# Altium schematic sheet POWER_DISTRIBUTION.SchDoc: Main_Power_Supp
size A3; Author: f; SheetNumber: 3; SheetTotal: 17
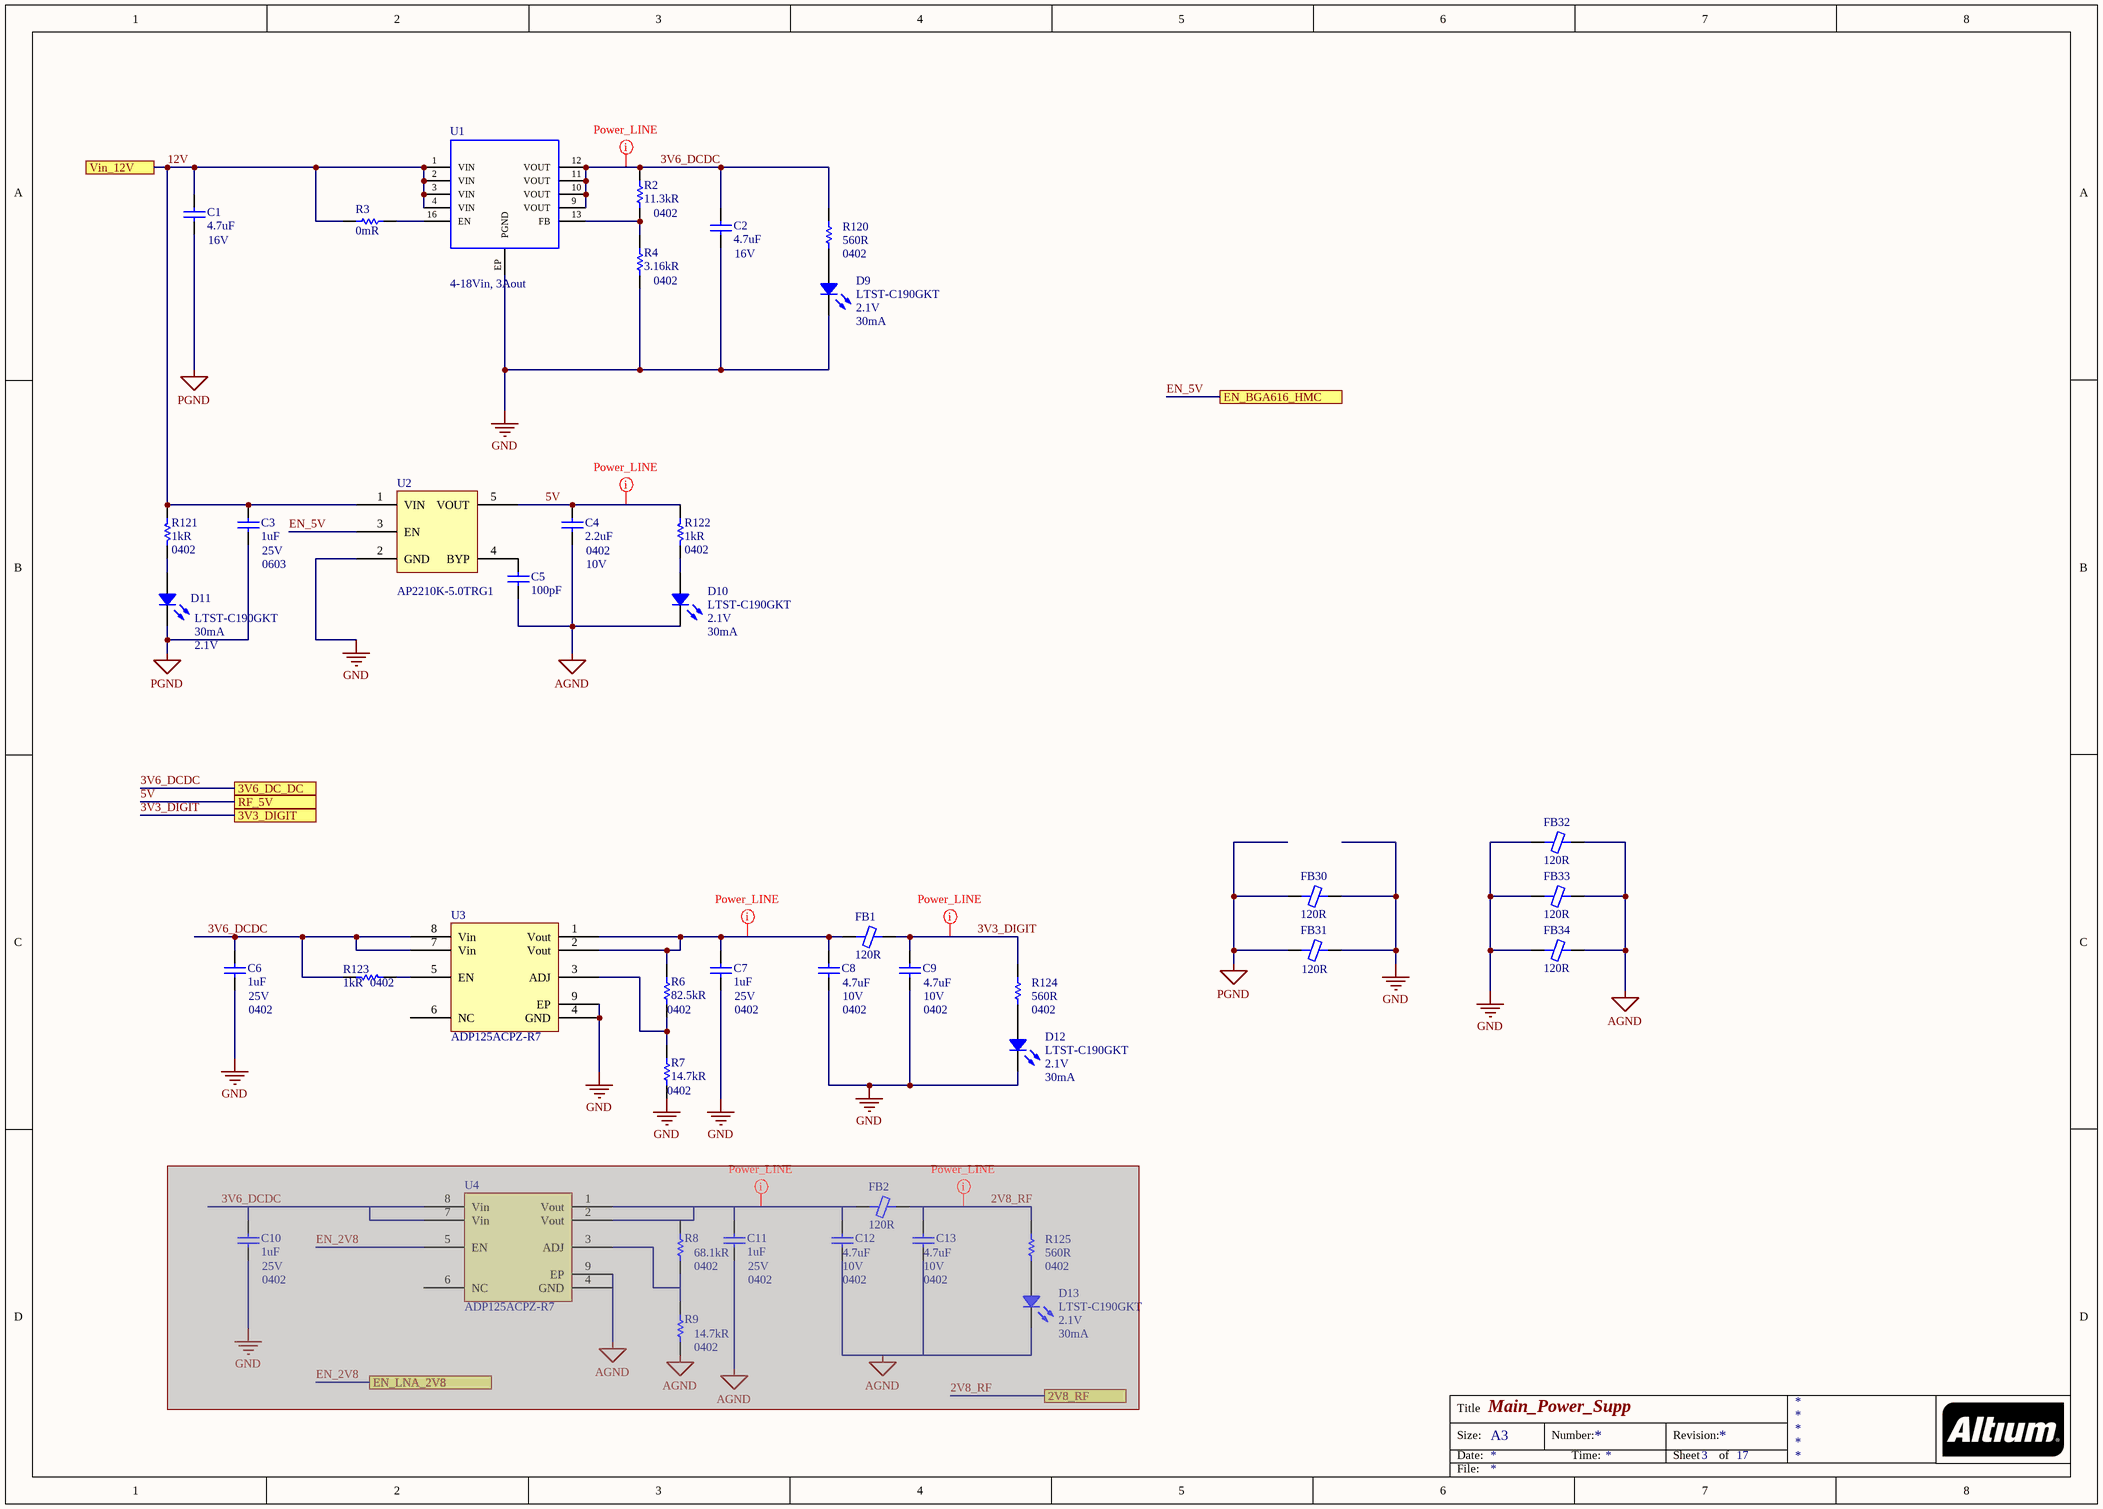
[diagram p0: POWER_DISTRIBUTION.SchDoc]

## Parts
C1  4.7uF  Voltage: 16V  [CAP 0603/1608 RF]
C2  4.7uF  Voltage: 16V  [CAP 0603/1608 RF]
C3  1uF  Case/Package: 0603  Voltage: 25V  [CAP 0603/1608 RF]
C4  2.2uF  Case Code (Imperial): 0402  Voltage Rating (DC): 10V  [CAP 0402/1005 RF KK]
C5  100pF  [CAP 0402/1005 RF KK]
C6  1uF  Case/Package: 0402  Voltage Rating: 25V  [CAP 0402/1005 RF KK]
C7  1uF  Case/Package: 0402  Voltage Rating: 25V  [CAP 0402/1005 RF KK]
C8  4.7uF  Case/Package: 0402  Voltage Rating: 10V  [CAP 0402/1005 RF KK]
C9  4.7uF  Case/Package: 0402  Voltage Rating: 10V  [CAP 0402/1005 RF KK]
C10  1uF  Case/Package: 0402  Voltage Rating: 25V  [CAP 0402/1005 RF KK]  (masked out: inside a compile mask, not in the netlist)
C11  1uF  Case/Package: 0402  Voltage Rating: 25V  [CAP 0402/1005 RF KK]  (masked out: inside a compile mask, not in the netlist)
C12  4.7uF  Case/Package: 0402  Voltage Rating: 10V  [CAP 0402/1005 RF KK]  (masked out: inside a compile mask, not in the netlist)
C13  4.7uF  Case/Package: 0402  Voltage Rating: 10V  [CAP 0402/1005 RF KK]  (masked out: inside a compile mask, not in the netlist)
D9  LTST-C190GKT  Forward Voltage: 2.1V  Forward Current: 30mA  [LED 0603/1608 GREEN]
D10  LTST-C190GKT  Forward Voltage: 2.1V  Forward Current: 30mA  [LED 0603/1608 GREEN]
D11  LTST-C190GKT  Forward Voltage: 2.1V  Forward Current: 30mA  [LED 0603/1608 GREEN]
D12  LTST-C190GKT  Forward Voltage: 2.1V  Forward Current: 30mA  [LED 0603/1608 GREEN]
D13  LTST-C190GKT  Forward Voltage: 2.1V  Forward Current: 30mA  [LED 0603/1608 GREEN]  (masked out: inside a compile mask, not in the netlist)
FB1  120R  [FER 0603/1608 KK]
FB2  120R  [FER 0603/1608 KK]  (masked out: inside a compile mask, not in the netlist)
FB30  120R  [FER 0603/1608 KK]
FB31  120R  [FER 0603/1608 KK]
FB32  120R  [FER 0603/1608 KK]
FB33  120R  [FER 0603/1608 KK]
FB34  120R  [FER 0603/1608 KK]
R2  11.3kR  Case/Package: 0402  [RES 0402/1005 RF KK]
R3  0mR  [RES 0402/1005 RF KK]
R4  3.16kR  Case/Package: 0402  [RES 0402/1005 RF KK]
R6  82.5kR  Case/Package: 0402  [RES 0402/1005 RF KK]
R7  14.7kR  Case/Package: 0402  [RES 0402/1005 RF KK]
R8  68.1kR  Case/Package: 0402  [RES 0402/1005 RF KK]  (masked out: inside a compile mask, not in the netlist)
R9  14.7kR  Case/Package: 0402  [RES 0402/1005 RF KK]  (masked out: inside a compile mask, not in the netlist)
R120  560R  Case/Package: 0402  [RES 0402/1005 RF KK]
R121  1kR  Case/Package: 0402  [RES 0402/1005 RF KK]
R122  1kR  Case/Package: 0402  [RES 0402/1005 RF KK]
R123  1kR  Case/Package: 0402  [RES 0402/1005 RF KK]
R124  560R  Case/Package: 0402  [RES 0402/1005 RF KK]
R125  560R  Case/Package: 0402  [RES 0402/1005 RF KK]  (masked out: inside a compile mask, not in the netlist)
U1  4-18Vin, 3Aout  [LGA-16EP]
U2  AP2210K-5.0TRG1  [AP2210K-3.3TRG1]
U3  ADP125ACPZ-R7  [ADP124_125]
U4  ADP125ACPZ-R7  [ADP124_125]  (masked out: inside a compile mask, not in the netlist)

## Ports
2V8_RF, 3V3_DIGIT, 3V6_DC_DC, EN_BGA616_HMC, EN_LNA_2V8, RF_5V, Vin_12V

## Nets
AGND: C4.1 C5.1 D10.2 FB32.2 FB33.2 FB34.2
GND: C2.1 C6.1 C7.1 C8.1 C9.1 D9.2 D12.2 FB30.2 FB31.2 FB32.1 FB33.1 FB34.1 R4.1 R7.1 U1.EP(PGND) U2.2(GND) U3.4(GND) U3.9(EP)
PGND: C1.1 C3.1 D11.2 FB30.1 FB31.1
3V3_DIGIT: C9.2 FB1.2 R124.2 ; port 3V3_DIGIT
3V6_DCDC: C2.2 C6.2 R2.2 R120.2 R123.1 U1.9(VOUT) U1.10(VOUT) U1.11(VOUT) U1.12(VOUT) U3.7(Vin) U3.8(Vin) ; port 3V6_DC_DC
5V: C4.2 R122.2 U2.5(VOUT) ; port RF_5V
12V: C1.2 C3.2 R3.2 R121.2 U1.1(VIN) U1.2(VIN) U1.3(VIN) U1.4(VIN) U2.1(VIN) ; port Vin_12V
EN_5V: U2.3(EN) ; port EN_BGA616_HMC
NetC5_2: C5.2 U2.4(BYP)
NetC7_2: C7.2 C8.2 FB1.1 R6.2 U3.1(Vout) U3.2(Vout)
NetD9_1: D9.1 R120.1
NetD10_1: D10.1 R122.1
NetD11_1: D11.1 R121.1
NetD12_1: D12.1 R124.1
NetR2_1: R2.1 R4.2 U1.13(FB)
NetR3_1: R3.1 U1.16(EN)
NetR6_1: R6.1 R7.2 U3.3(ADJ)
NetR123_2: R123.2 U3.5(EN)

Not connected (* = marked no-connect by the designer): U3 6(NC)

## Layout directives
net class Power_LINE: 3V3_DIGIT, 3V6_DCDC, 5V, (no net found under the mark), NetC7_2

## Notes on the sheet
- Title
- Size:
- Date:
- A3
- Number:
- Time:
- Revision:
- Sheet
- of
- File:

## Library data of the parts
C1 C2 = Capacitor: TAIYO YUDEN - EMK107ABJ475MA-T - SMD Multilayer Ceramic Capacitor, 4.7 µF, 16 V, 0603 [1608 Metric], ± 20%, X5R, M Series; Supplier 1: Digi-Key; Supplier Part Number 1: 587-6003-1-ND; Manufacturer: Taiyo Yuden; Manufacturer Part Number: EMK107ABJ475MA-T; RoHS: Yes; Category: Ceramic Capacitors; Stock 1: 5; Pricing 1: 1=0,28000, 10=0,19200, 50=0,12820, 100=0,10900, 500=0,07696, 1000=0,06734 (USD); Mount: Surface Mount; Case/Package: Ceramic; Min Operating Temperature: -55°C; Max Operating Temperature: 85°C; Capacitance: 4.7uF; Tolerance: 20%; Packaging: Tape and Reel; Dielectric: X5R; Length: 1.6mm; Height: 0.8mm; Depth: 0.8mm; Radiation Hardening: No; Lead Free: Lead Free; ComponentLink1URL: https://datasheet.ciiva.com/26871/getdatasheetpartid-637315-26871304.pdf?src-supplier=Verical; ComponentLink1Description: https://datasheet.ciiva.com/26871/getdatasheetpartid-637315-26871304.pdf?src-supplier=Verical
C3 = Capacitor: Manufacturer 1: Samsung; Manufacturer Part Number 1: CL10A105KA8NNNC; Material: Ceramic; Tolerance: 10%; Dielectric: X5R; Supplier 1: Digi-Key; Supplier Part Number 1: 1276-1102-1-ND; Stock 1: 3421596; Pricing 1: 1=0.10000, 10=0.04100, 100=0.01850, 500=0.01320, 1000=0.01037 (USD); RoHS: Yes; Mount: Surface Mount; Case Code (Metric): 1608; Case Code (Imperial): 0603; Contact Plating: Tin; Min Operating Temperature: -55°C; Max Operating Temperature: 85°C; Capacitance: 1uF; Voltage Rating (DC): 25V; Packaging: Tape and Reel; Package Quantity: 1; Voltage Rating: 25V; Length: 1.6mm; Height: 0.8mm; Depth: 0.8mm; Width: 0.031inch; Thickness: 0.035inch; Radiation Hardening: No; Lead Free: Lead Free; ComponentLink1URL: https://datasheet.ciiva.com/25801/cl10a105ka8nnnc-25801364.pdf?src-supplier=Digi-Key; ComponentLink1Description: https://datasheet.ciiva.com/25801/cl10a105ka8nnnc-25801364.pdf?src-supplier=Digi-Key; ComponentLink2URL: https://datasheet.ciiva.com/26838/getdatasheetpartid-357530-26838332.pdf?src-supplier=Verical; ComponentLink2Description: https://datasheet.ciiva.com/26838/getdatasheetpartid-357530-26838332.pdf?src-supplier=Verical; ComponentLink3URL: https://datasheet.ciiva.com/29198/458162-da-01-en-vs-kondensator-0603-29198475.pdf?src-supplier=Conrad; ComponentLink3Description: https://datasheet.ciiva.com/29198/458162-da-01-en-vs-kondensator-0603-29198475.pdf?src-supplier=Conrad
C4 = Capacitor: MURATA - GRM155R61A225KE95D - Keramikvielschichtkondensator, SMD, 2.2 µF, 10 V, 0402 [Metrisch 1005], ± 10%, X5R, Baureihe GRM; Material: Ceramic; Supplier 1: Digi-Key; Supplier Part Number 1: 490-10451-1-ND; Manufacturer: Murata; Manufacturer Part Number: GRM155R61A225KE95D; RoHS: Yes; Category: Ceramic Capacitors; Stock 1: 502318; Pricing 1: 1=0,11000, 10=0,07700, 50=0,04380, 100=0,03630, 500=0,02546, 1000=0,02108, 2500=0,01962, 5000=0,01795 (USD); Mount: Surface Mount; Case/Package: 0402; Weight: 0.000212oz; Case Code (Metric): 1005; Min Operating Temperature: -55°C; Max Operating Temperature: 85°C; Dielectric: X5R; Termination: SMD/SMT; Package Quantity: 10000; Capacitance: 2.2uF; Tolerance: 10%; Voltage Rating: 10V; Packaging: Tape and Reel; Length: 1mm; Height: 0.5mm; Thickness: 0.022inch; Depth: 0.5mm; Width: 0.5mm; REACH SVHC: No SVHC; Lead Free: Lead Free; ComponentLink1URL: http://www.mouser.com/ds/2/281/c02e-2905.pdf?src-supplier=Mouser; ComponentLink1Description: http://www.mouser.com/ds/2/281/c02e-2905.pdf?src-supplier=Mouser; ComponentLink2URL: http://components.arrow.com/part/dataview/0323_04264073?src-supplier=Arrow+Europe; ComponentLink2Description: http://components.arrow.com/part/dataview/0323_04264073?src-supplier=Arrow+Europe; ComponentLink3URL: http://www.farnell.com/datasheets/1872202.pdf?src-supplier=Farnell; ComponentLink3Description: http://www.farnell.com/datasheets/1872202.pdf?src-supplier=Farnell; ComponentLink4URL: http://www.farnell.com/datasheets/2047915.pdf?src-supplier=Farnell; ComponentLink4Description: http://www.farnell.com/datasheets/2047915.pdf?src-supplier=Farnell; ComponentLink5URL: http://www.farnell.com/datasheets/1872202.pdf?src-supplier=Element14; ComponentLink5Description: http://www.farnell.com/datasheets/1872202.pdf?src-supplier=Element14; ComponentLink6URL: http://www.farnell.com/datasheets/1872202.pdf?src-supplier=Newark; ComponentLink6Description: http://www.farnell.com/datasheets/1872202.pdf?src-supplier=Newark; ComponentLink7URL: http://psearch.en.murata.com/capacitor/product/GRM155R61A225KE95%23.pdf?src-supplier=Avnet; ComponentLink7Description: http://psearch.en.murata.com/capacitor/product/GRM155R61A225KE95%23.pdf?src-supplier=Avnet; ComponentLink8URL: http://www.farnell.com/datasheets/2047915.pdf?src-supplier=Element14; ComponentLink8Description: http://www.farnell.com/datasheets/2047915.pdf?src-supplier=Element14; ComponentLink9URL: https://search.murata.co.jp/Ceramy/image/img/A01X/G101/ENG/GRM155R61A225KE95-01.pdf?src-supplier=Digi-Key; ComponentLink9Description: https://search.murata.co.jp/Ceramy/image/img/A01X/G101/ENG/GRM155R61A225KE95-01.pdf?src-supplier=Digi-Key; ComponentLink10URL: http://www.farnell.com/datasheets/2047915.pdf?src-supplier=Newark; ComponentLink10Description: http://www.farnell.com/datasheets/2047915.pdf?src-supplier=Newark
C5 = Capacitor: Manufacturer 1: KEMET; Manufacturer Part Number 1: C0402C101J5GACAUTO; Dielectric Material: Ceramic; Tolerance: 5%; Voltage Rating: 50V; Dielectric: C0G; Supplier 1: Digi-Key; Supplier Part Number 1: 399-6823-1-ND; Stock 1: 66452; Pricing 1: 1=0.11000, 10=0.08400, 100=0.03730, 500=0.02664, 1000=0.02093, 2500=0.01903, 5000=0.01751 (USD); RoHS: Yes; Mount: Surface Mount; Case/Package: 0402; Case Code (Metric): 1005; Case Code (Imperial): 0402; Min Operating Temperature: -55°C; Max Operating Temperature: 125°C; Package Quantity: 10000; Capacitance: 100pF; Packaging: Tape and Reel; Voltage Rating (DC): 50V; Length: 1mm; Width: 0.02inch; Thickness: 0.022inch; Depth: 0.5mm; Ratings: AEC-Q200; Radiation Hardening: No; REACH SVHC: No SVHC; Lead Free: Lead Free; ComponentLink1URL: https://datasheet.ciiva.com/26923/getdatasheetpartid-385375-26923866.pdf?src-supplier=Verical; ComponentLink1Description: https://datasheet.ciiva.com/26923/getdatasheetpartid-385375-26923866.pdf?src-supplier=Verical
C6 C7 C10 C11 = Capacitor: MURATA - GRT155R61E105KE01D - SMD Multilayer Ceramic Capacitor, 1 µF, 25 V, 0402 [1005 Metric], ± 10%, X5R, GRT Series - SMD Multilayer Ceramic Capacitor, 1 µF, 25 V, 0402 [1005 Metric], ± 10%, X5R, GRT Series; Supplier 1: Digi-Key; Supplier Part Number 1: 490-12263-1-ND; Manufacturer: Murata; Manufacturer Part Number: GRT155R61E105KE01D; RoHS: Yes; Category: Ceramic Capacitors; Stock 1: 341453; Pricing 1: 1=0,18000, 10=0,12300, 100=0,06210, 500=0,04248, 1000=0,03758, 2500=0,03594, 5000=0,03268 (USD); Mount: Surface Mount; Case Code (Metric): 1005; Case Code (Imperial): 0402; Min Operating Temperature: -55°C; Max Operating Temperature: 85°C; Packaging: Tape and Reel; Capacitance: 1uF; Tolerance: 10%; Dielectric: X5R; Voltage Rating (DC): 25V; Length: 0.039inch; Width: 0.02inch; Thickness: 0.022inch; Ratings: AEC-Q200; ComponentLink1URL: http://www.farnell.com/datasheets/2165918.pdf?src-supplier=Farnell; ComponentLink1Description: http://www.farnell.com/datasheets/2165918.pdf?src-supplier=Farnell; ComponentLink2URL: http://search.murata.co.jp/Ceramy/image/img/A01X/G101/ENG/GRT155R61E105KE01-01.pdf?src-supplier=Digi-Key; ComponentLink2Description: http://search.murata.co.jp/Ceramy/image/img/A01X/G101/ENG/GRT155R61E105KE01-01.pdf?src-supplier=Digi-Key; ComponentLink3URL: http://www.farnell.com/datasheets/2165918.pdf?src-supplier=Element14; ComponentLink3Description: http://www.farnell.com/datasheets/2165918.pdf?src-supplier=Element14
C8 C9 C12 C13 = Capacitor: Manufacturer 1: Murata; Manufacturer Part Number 1: GRM155R61A475MEAAD; Tolerance: 20%; Supplier 1: Digi-Key; Supplier Part Number 1: 490-14306-1-ND; Stock 1: 1535315; Pricing 1: 1=0.23000, 10=0.15400, 100=0.07780, 500=0.05322, 1000=0.04708, 2500=0.04504, 5000=0.04094 (USD); Mount: Surface Mount; Case Code (Imperial): 0402; Case Code (Metric): 1005; Min Operating Temperature: -55°C; Max Operating Temperature: 85°C; Packaging: Tape and Reel; Capacitance: 4.7uF; ComponentLink1URL: http://www.farnell.com/datasheets/2189109.pdf?src-supplier=Farnell; ComponentLink1Description: http://www.farnell.com/datasheets/2189109.pdf?src-supplier=Farnell; ComponentLink2URL: https://search.murata.co.jp/Ceramy/image/img/A01X/G101/ENG/GRM155R61A475MEAA-01.pdf?src-supplier=Digi-Key; ComponentLink2Description: https://search.murata.co.jp/Ceramy/image/img/A01X/G101/ENG/GRM155R61A475MEAA-01.pdf?src-supplier=Digi-Key; ComponentLink3URL: http://datasheet.octopart.com/GRM155R61A475MEAAD-Murata-datasheet-68589269.pdf?src-supplier=Newark; ComponentLink3Description: http://datasheet.octopart.com/GRM155R61A475MEAAD-Murata-datasheet-68589269.pdf?src-supplier=Newark; ComponentLink4URL: http://datasheet.octopart.com/GRM155R61A475MEAAD-Murata-datasheet-8819587.pdf; ComponentLink4Description: http://datasheet.octopart.com/GRM155R61A475MEAAD-Murata-datasheet-8819587.pdf; ComponentLink5URL: http://datasheet.octopart.com/GRM155R61A475MEAAD-Murata-datasheet-10025737.pdf; ComponentLink5Description: http://datasheet.octopart.com/GRM155R61A475MEAAD-Murata-datasheet-10025737.pdf; ComponentLink6URL: http://datasheet.octopart.com/GRM155R61A475MEAAD-Murata-datasheet-11978611.pdf; ComponentLink6Description: http://datasheet.octopart.com/GRM155R61A475MEAAD-Murata-datasheet-11978611.pdf; ComponentLink7URL: http://datasheet.octopart.com/GRM155R61A475MEAAD-Murata-datasheet-12510076.pdf; ComponentLink7Description: http://datasheet.octopart.com/GRM155R61A475MEAAD-Murata-datasheet-12510076.pdf; ComponentLink8URL: http://datasheet.octopart.com/GRM155R61A475MEAAD-Murata-datasheet-12515295.pdf; ComponentLink8Description: http://datasheet.octopart.com/GRM155R61A475MEAAD-Murata-datasheet-12515295.pdf
D9-D13 = LTST-C190GKT: LED,  LTST-C190GKT; Manufacturer 1: Vishay Lite-On; Color: Green; Lens Color: Colorless; Luminous Intensity: 6mcd; Viewing Angle: 130°; Lens Style: Clear,Diffused,Colorless,Rectangular; Power Rating: 100mW; Dominant Wavelength: 569nm; Test Current: 10mA; Lens Transparency: Clear; Number of Elements: 1; Wavelength: 565nm; Voltage: 2V; Reverse Voltage: 5V; Supplier 1: Digi-Key; Manufacturer Part Number 1: LTST-C190GKT; Stock 1: 908158; Pricing 1: 1=0.26000, 10=0.18800, 100=0.08880, 500=0.05922, 1000=0.04639 (USD); RoHS: Yes; Mount: Surface Mount; Case/Package: 0603; Number of Pins: 2; Case Code (Metric): 1608; Case Code (Imperial): 0603; Min Operating Temperature: -55°C; Max Operating Temperature: 85°C; Package Quantity: 1; Packaging: Tape and Reel; Illumination Color: Green; Power Dissipation: 100mW; Number of LEDs: 1; Length: 1.6mm; Height: 0.8mm; Width: 0.8mm; Depth: 0.8mm; Radiation Hardening: No; Lead Free: Lead Free; ComponentLink1URL: https://datasheet.ciiva.com/11775/0900766b80dc02a6-11775616.pdf?src-supplier=RSComponents; ComponentLink1Description: https://datasheet.ciiva.com/11775/0900766b80dc02a6-11775616.pdf?src-supplier=RSComponents; ComponentLink2URL: https://datasheet.ciiva.com/2109/ltst-c190gkt-2109985.pdf?src-supplier=Digi-Key; ComponentLink2Description: https://datasheet.ciiva.com/2109/ltst-c190gkt-2109985.pdf?src-supplier=Digi-Key; ComponentLink3URL: https://datasheet.ciiva.com/16392/lite-on20ltst-c190gkt-16392818.pdf?src-supplier=Future+Electronics; ComponentLink3Description: https://datasheet.ciiva.com/16392/lite-on20ltst-c190gkt-16392818.pdf?src-supplier=Future+Electronics; ComponentLink4URL: https://datasheet.ciiva.com/12403/lite-on-ltst-c190gkt-187204-12403884.pdf?src-supplier=Mouser; ComponentLink4Description: https://datasheet.ciiva.com/12403/lite-on-ltst-c190gkt-187204-12403884.pdf?src-supplier=Mouser; ComponentLink5URL: https://datasheet.ciiva.com/2109/ltst-c190gkt-2109986.pdf?src-supplier=Digi-Key; ComponentLink5Description: https://datasheet.ciiva.com/2109/ltst-c190gkt-2109986.pdf?src-supplier=Digi-Key; ComponentLink6URL: https://datasheet.ciiva.com/2109/ltst-c190gkt-2109987.pdf?src-supplier=Digi-Key; ComponentLink6Description: https://datasheet.ciiva.com/2109/ltst-c190gkt-2109987.pdf?src-supplier=Digi-Key; Supplier Part Number 1: 160-1183-1-ND
FB1 FB2 FB30-FB34 = Ferrite: Manufacturer 1: TDK; Manufacturer Part Number 1: MPZ1608S121ATAH0; Current Rating: 2A; Tolerance: 25%; DC Resistance (DCR): 45mR; Supplier 1: Digi-Key; Supplier Part Number 1: 445-5219-1-ND; Stock 1: 68096; Pricing 1: 1=0.10000, 10=0.07900, 25=0.07160, 50=0.06440, 100=0.04720, 250=0.03432, 500=0.03146, 1000=0.02717 (USD); RoHS: Yes; Mount: Surface Mount; Case/Package: 0603; Core Material: Ferrite; Case Code (Metric): 1608; Case Code (Imperial): 0603; Package Quantity: 4000; Packaging: Tape and Reel; Impedance: 120R; Max DC Current: 2A; Length: 0.063inch; Height: 0.03inch; Width: 0.031inch; Depth: 0.8mm; ComponentLink1URL: https://datasheet.ciiva.com/46634/beads-commercial-power-mpz-en-46634726.pdf?src-supplier=Digi-Key; ComponentLink1Description: https://datasheet.ciiva.com/46634/beads-commercial-power-mpz-en-46634726.pdf?src-supplier=Digi-Key; ComponentLink2URL: https://datasheet.ciiva.com/46634/beads-commercial-power-mpz-en-46634728.pdf?src-supplier=Digi-Key; ComponentLink2Description: https://datasheet.ciiva.com/46634/beads-commercial-power-mpz-en-46634728.pdf?src-supplier=Digi-Key; ComponentLink3URL: https://datasheet.ciiva.com/48682/beads-commercial-power-mpz-en-48682494.pdf?src-supplier=Avnet; ComponentLink3Description: https://datasheet.ciiva.com/48682/beads-commercial-power-mpz-en-48682494.pdf?src-supplier=Avnet
R2 = Resistor: Res Thick Film 0402 11.3K Ohm 1% 0.063W(1/16W) ?100ppm/C Molded SMD Automotive Punched Paper T/R; Manufacturer: KOA Speer; Manufacturer Part Number: RK73H1ETTP1132F; Power Rating: 63mW; Voltage Rating: 50V; Temperature Coefficient: 100ppm/°C; Supplier 1: Digi-Key; Supplier Part Number 1: 2019-RK73H1ETTP1132FCT-ND; RoHS: Yes; Category: Chip SMD Resistors; Stock 1: 30242; Pricing 1: 1=0,10000, 10=0,02400, 100=0,00970, 1000=0,00437, 2500=0,00380, 5000=0,00314 (USD); Case Code (Imperial): 0402; Case Code (Metric): 1005; Min Operating Temperature: -55°C; Max Operating Temperature: 155°C; Resistance: 11.3kR; Tolerance: 1%; Packaging: Tape and Reel; Package Quantity: 10000; Termination: SMD/SMT; Voltage Rating (DC): 50V; Length: 1mm; Height: 0.35mm; Width: 0.5mm; Lead Free: Lead Free; ComponentLink1URL: https://datasheet.ciiva.com/5555/rk73h-5555082.pdf?src-supplier=Mouser; ComponentLink1Description: https://datasheet.ciiva.com/5555/rk73h-5555082.pdf?src-supplier=Mouser
R3 = Resistor: YAGEO - RC0402JR-070RL. - RES, THICK FILM, 0R, 0.0625W, 0402; Power Rating: 62.5mW; Tolerance: 5%; Voltage Rating: 50V; Max Power Dissipation: 63mW; Temperature Coefficient: 200ppm/°C; Supplier 1: Digi-Key; Supplier Part Number 1: 311-0.0JRCT-ND; Manufacturer: Yageo; Manufacturer Part Number: RC0402JR-070RL; RoHS: Yes; Category: Chip SMD Resistors; Stock 1: 45338179; Pricing 1: 1=0,10000, 10=0,01200, 25=0,00920, 50=0,00680, 100=0,00510, 250=0,00388, 500=0,00310, 1000=0,00228, 5000=0,00163 (USD); Case/Package: 0402; Case Code (Metric): 1005; Case Code (Imperial): 0402; Contact Plating: Tin,Matte; Min Operating Temperature: -55°C; Max Operating Temperature: 155°C; Package Quantity: 1; Resistance: 0mR; Packaging: Tape and Reel; Resistor Type: Thick Film; Number of Terminations: 2; Termination: SMD/SMT; Features: Moisture Resistant; Length: 1mm; Height: 0.016inch; Width: 0.02inch; Depth: 0.5mm; Radiation Hardening: No; REACH SVHC: Unknown; Military Standard: Not; Lead Free: Lead Free; ComponentLink1URL: https://datasheet.ciiva.com/2452/pyu-rc0402-51-rohs-l-6-2452608.pdf?src-supplier=Digi-Key; ComponentLink1Description: https://datasheet.ciiva.com/2452/pyu-rc0402-51-rohs-l-6-2452608.pdf?src-supplier=Digi-Key; ComponentLink2URL: https://datasheet.ciiva.com/11808/0900766b80c66297-11808195.pdf?src-supplier=RSComponents; ComponentLink2Description: https://datasheet.ciiva.com/11808/0900766b80c66297-11808195.pdf?src-supplier=RSComponents; ComponentLink3URL: https://datasheet.ciiva.com/2452/pyu-r-int-thick-7-2452609.pdf?src-supplier=Digi-Key; ComponentLink3Description: https://datasheet.ciiva.com/2452/pyu-r-int-thick-7-2452609.pdf?src-supplier=Digi-Key; ComponentLink4URL: https://datasheet.ciiva.com/2452/pyu-r-int-thick-7-2452610.pdf?src-supplier=Digi-Key; ComponentLink4Description: https://datasheet.ciiva.com/2452/pyu-r-int-thick-7-2452610.pdf?src-supplier=Digi-Key; ComponentLink5URL: https://datasheet.ciiva.com/8896/pyu-rc0402-51-rohs-l-6-8896201.pdf?src-supplier=Avnet; ComponentLink5Description: https://datasheet.ciiva.com/8896/pyu-rc0402-51-rohs-l-6-8896201.pdf?src-supplier=Avnet; ComponentLink6URL: https://datasheet.ciiva.com/28386/pyu-rc0402-51-rohs-l-6-28386633.pdf?src-supplier=Avnet+Europe; ComponentLink6Description: https://datasheet.ciiva.com/28386/pyu-rc0402-51-rohs-l-6-28386633.pdf?src-supplier=Avnet+Europe; ComponentLink7URL: https://datasheet.ciiva.com/22747/1018594-22747515.pdf?src-supplier=Element14; ComponentLink7Description: https://datasheet.ciiva.com/22747/1018594-22747515.pdf?src-supplier=Element14; ComponentLink8URL: https://datasheet.ciiva.com/15189/getdatasheetpartid-326379-15189533.pdf?src-supplier=Verical; ComponentLink8Description: https://datasheet.ciiva.com/15189/getdatasheetpartid-326379-15189533.pdf?src-supplier=Verical
R4 = Resistor: Res 3.16K Ohm 1% 1/10W 0402; Manufacturer: KOA Speer; Manufacturer Part Number: RK73H1ETTP3161F; Power Rating: 63mW; Voltage Rating: 50V; Temperature Coefficient: 100ppm/°C; Supplier 1: Digi-Key; Supplier Part Number 1: 2019-RK73H1ETTP3161FCT-ND; RoHS: Yes; Category: Chip SMD Resistors; Stock 1: 51983; Pricing 1: 1=0,10000, 10=0,02400, 100=0,00970, 1000=0,00437, 2500=0,00380, 5000=0,00314 (USD); Case Code (Imperial): 0402; Case Code (Metric): 1005; Min Operating Temperature: -55°C; Max Operating Temperature: 155°C; Resistance: 3.16kR; Tolerance: 1%; Packaging: Tape and Reel; Package Quantity: 10000; Termination: SMD/SMT; Voltage Rating (DC): 50V; Length: 1mm; Height: 0.35mm; Width: 0.5mm; Lead Free: Lead Free; ComponentLink1URL: http://components.arrow.com/part/dataview/39721259S8912956N5146?src-supplier=Arrow; ComponentLink1Description: http://components.arrow.com/part/dataview/39721259S8912956N5146?src-supplier=Arrow; ComponentLink2URL: http://www.mouser.com/ds/2/219/RK73H-5715.pdf?src-supplier=Mouser; ComponentLink2Description: http://www.mouser.com/ds/2/219/RK73H-5715.pdf?src-supplier=Mouser
R6 = Resistor: RES SMD 82.5K OHM 1% 1/16W 0402; Manufacturer: Yageo; Manufacturer Part Number: RC0402FR-0782K5L; Voltage Rating (DC): 50V; Power Rating: 62.5mW; Temperature Coefficient: 100ppm/°C; Max Power Dissipation: 63mW; Supplier 1: Digi-Key; Supplier Part Number 1: 311-82.5KLRCT-ND; RoHS: Yes; Category: Chip SMD Resistors; Stock 1: 431716; Pricing 1: 1=0,10000, 10=0,01600, 100=0,00640, 1000=0,00289, 2500=0,00251, 5000=0,00207 (USD); Case Code (Imperial): 0402; Case Code (Metric): 1005; Min Operating Temperature: -55°C; Max Operating Temperature: 155°C; Tolerance: 1%; Resistance: 82.5kR; Packaging: Tape and Reel; Package Quantity: 1; Voltage Rating: 50V; Termination: SMD/SMT; Composition: Thick Film; Number of Terminations: 2; Military Standard: Not; Features: Moisture Resistant; Length: 1mm; Height: 0.016inch; Width: 0.02inch; Depth: 0.5mm; Lead Free: Lead Free; ComponentLink1URL: https://datasheet.ciiva.com/2453/pyu-r-int-thick-7-2453589.pdf?src-supplier=Digi-Key; ComponentLink1Description: https://datasheet.ciiva.com/2453/pyu-r-int-thick-7-2453589.pdf?src-supplier=Digi-Key; ComponentLink2URL: https://datasheet.ciiva.com/2453/pyu-r-int-thick-7-2453590.pdf?src-supplier=Digi-Key; ComponentLink2Description: https://datasheet.ciiva.com/2453/pyu-r-int-thick-7-2453590.pdf?src-supplier=Digi-Key; ComponentLink3URL: https://datasheet.ciiva.com/2453/pyu-r-int-thick-7-2453591.pdf?src-supplier=Digi-Key; ComponentLink3Description: https://datasheet.ciiva.com/2453/pyu-r-int-thick-7-2453591.pdf?src-supplier=Digi-Key
R7 R9 = Resistor: Res Thick Film 0402 14.7K Ohm 1% 0.063W(1/16W) ±100ppm/C Epoxy SMD T/R; Manufacturer: Yageo; Manufacturer Part Number: RC0402FR-0714K7L; Power Rating: 62.5mW; Voltage Rating: 50V; Temperature Coefficient: 100ppm/°C; Max Power Dissipation: 63mW; Supplier 1: Digi-Key; Supplier Part Number 1: YAG2984CT-ND; RoHS: Yes; Category: Chip SMD Resistors; Stock 1: 135925; Pricing 1: 1=0,10000, 10=0,01600, 100=0,00640, 1000=0,00289, 2500=0,00251, 5000=0,00207 (USD); Case Code (Imperial): 0402; Case Code (Metric): 1005; Contact Plating: Tin,Matte; Min Operating Temperature: -55°C; Max Operating Temperature: 155°C; Tolerance: 1%; Resistance: 14.7kR; Packaging: Tape and Reel; Composition: Thick Film; Number of Terminations: 2; Termination: SMD/SMT; Military Standard: Not; Features: Moisture Resistant; Length: 1mm; Height: 0.016inch; Width: 0.02inch; Depth: 0.5mm; Radiation Hardening: No; Lead Free: Lead Free; ComponentLink1URL: https://datasheet.ciiva.com/12668/pyu-rc0402-51-rohs-l-6-r-12668214.pdf?src-supplier=Mouser; ComponentLink1Description: https://datasheet.ciiva.com/12668/pyu-rc0402-51-rohs-l-6-r-12668214.pdf?src-supplier=Mouser; ComponentLink2URL: https://datasheet.ciiva.com/28404/pyu-rc0402-51-rohs-l-6-28404249.pdf?src-supplier=Avnet+Europe; ComponentLink2Description: https://datasheet.ciiva.com/28404/pyu-rc0402-51-rohs-l-6-28404249.pdf?src-supplier=Avnet+Europe; ComponentLink3URL: https://datasheet.ciiva.com/8890/pyu-rc0402-51-rohs-l-6-8890796.pdf?src-supplier=Avnet; ComponentLink3Description: https://datasheet.ciiva.com/8890/pyu-rc0402-51-rohs-l-6-8890796.pdf?src-supplier=Avnet; ComponentLink4URL: https://datasheet.ciiva.com/16869/pyu-rc0402-51-rohs-l-6-16869068.pdf?src-supplier=Avnet+Europe; ComponentLink4Description: https://datasheet.ciiva.com/16869/pyu-rc0402-51-rohs-l-6-16869068.pdf?src-supplier=Avnet+Europe; ComponentLink5URL: https://datasheet.ciiva.com/26829/getdatasheetpartid-326415-26829900.pdf?src-supplier=Verical; ComponentLink5Description: https://datasheet.ciiva.com/26829/getdatasheetpartid-326415-26829900.pdf?src-supplier=Verical
R8 = Resistor: RMCF Series 0402 Case 68.1 kOhm ±1 % ±200 ppm/°C SMT Thick Film Chip Resistor; Manufacturer: Stackpole Electronics; Manufacturer Part Number: RMCF0402FT68K1; Max Power Dissipation: 63mW; Temperature Coefficient: 100ppm/°C; Tolerance: 1%; Supplier 1: Digi-Key; Supplier Part Number 1: RMCF0402FT68K1CT-ND; RoHS: Yes; Category: Chip SMD Resistors; Stock 1: 129572; Pricing 1: 1=0,10000, 10=0,01400, 100=0,00580, 1000=0,00262, 2500=0,00228, 5000=0,00188 (USD); Mount: Surface Mount; Contact Plating: Tin,Matte; Case Code (Imperial): 0402; Case Code (Metric): 1005; Min Operating Temperature: -55°C; Max Operating Temperature: 155°C; Package Quantity: 10000; Packaging: Tape and Reel; Resistance: 68.1kR; Composition: Thick Film; Power Rating: 63mW; Number of Terminations: 2; Features: Automotive AEC-Q200; Length: 0.039inch; Height: 0.016inch; Width: 0.02inch; Radiation Hardening: No; Lead Free: Lead Free; ComponentLink1URL: http://components.arrow.com/part/dataview/50581464S124566N1174?src-supplier=Arrow; ComponentLink1Description: http://components.arrow.com/part/dataview/50581464S124566N1174?src-supplier=Arrow; ComponentLink2URL: https://www.seielect.com/catalog/sei-rmcf_rmcp.pdf?src-supplier=Digi-Key; ComponentLink2Description: https://www.seielect.com/catalog/sei-rmcf_rmcp.pdf?src-supplier=Digi-Key; ComponentLink3URL: https://www.seielect.com/catalog/SEI-Packaging.pdf?src-supplier=Digi-Key; ComponentLink3Description: https://www.seielect.com/catalog/SEI-Packaging.pdf?src-supplier=Digi-Key; ComponentLink4URL: https://www.seielect.com/catalog/SEI-RMCF_RMCP.pdf?src-supplier=Avnet; ComponentLink4Description: https://www.seielect.com/catalog/SEI-RMCF_RMCP.pdf?src-supplier=Avnet; ComponentLink5URL: http://www.seielect.com/Catalog/Sei-RMC.pdf?src-supplier=Future+Electronics; ComponentLink5Description: http://www.seielect.com/Catalog/Sei-RMC.pdf?src-supplier=Future+Electronics
R120 R124 R125 = Resistor: RES 560 OHM 5% 1/16W 0402; Manufacturer: Stackpole Electronics; Manufacturer Part Number: RMCF0402JT560R; Max Power Dissipation: 63mW; Temperature Coefficient: 100ppm/°C; Supplier 1: Digi-Key; Supplier Part Number 1: RMCF0402JT560RCT-ND; RoHS: Yes; Category: Chip SMD Resistors; Stock 1: 65817; Pricing 1: 1=0,10000, 10=0,01000, 100=0,00410, 1000=0,00186, 2500=0,00161, 5000=0,00133 (USD); Mount: Surface Mount; Case Code (Metric): 1005; Case Code (Imperial): 0402; Contact Plating: Tin,Matte; Min Operating Temperature: -55°C; Max Operating Temperature: 155°C; Resistor Type: Thick Film; Number of Terminations: 2; Tolerance: 5%; Packaging: Tape and Reel; Resistance: 560R; Power Rating: 63mW; Features: Automotive AEC-Q200; Length: 0.039inch; Height: 0.016inch; Width: 0.02inch; Radiation Hardening: No; Lead Free: Lead Free; ComponentLink1URL: http://components.arrow.com/part/dataview/50506686S89619N1174?src-supplier=Arrow+Electronics; ComponentLink1Description: http://components.arrow.com/part/dataview/50506686S89619N1174?src-supplier=Arrow+Electronics; ComponentLink2URL: https://www.seielect.com/catalog/SEI-Packaging.pdf?src-supplier=Digi-Key; ComponentLink2Description: https://www.seielect.com/catalog/SEI-Packaging.pdf?src-supplier=Digi-Key; ComponentLink3URL: http://www.seielect.com/Catalog/SEI-rmc.pdf?src-supplier=Future+Electronics; ComponentLink3Description: http://www.seielect.com/Catalog/SEI-rmc.pdf?src-supplier=Future+Electronics; ComponentLink4URL: https://www.seielect.com/catalog/SEI-RMCF_RMCP.pdf?src-supplier=Avnet; ComponentLink4Description: https://www.seielect.com/catalog/SEI-RMCF_RMCP.pdf?src-supplier=Avnet
R121-R123 = Resistor: Manufacturer 1: Yageo; Manufacturer Part Number 1: RC0402FR-071KL; Tolerance: 1%; Temperature Coefficient: 100ppm/°C; Power Rating: 62.5mW; Voltage Rating: 50V; Supplier 1: Digi-Key; Supplier Part Number 1: 311-1.00KLRCT-ND; Stock 1: 57541929; Pricing 1: 1=0,10000, 10=0,01600, 100=0,00640, 1000=0,00289, 2500=0,00251, 5000=0,00207 (USD); RoHS: Yes; Number of Pins: 2; Case Code (Imperial): 0402; Case Code (Metric): 1005; Min Operating Temperature: -55°C; Max Operating Temperature: 155°C; Packaging: Tape and Reel; Resistance: 1kR; Composition: Thick Film; Voltage Rating (DC): 50V; Termination: SMD/SMT; Military Standard: Not; Length: 1mm; Height: 0.32mm; Width: 0.5mm; Depth: 0.5mm; REACH SVHC: Unknown; Lead Free: Lead Free; ComponentLink1URL: https://datasheet.ciiva.com/11819/0900766b80c66297-11819477.pdf?src-supplier=RSComponents; ComponentLink1Description: https://datasheet.ciiva.com/11819/0900766b80c66297-11819477.pdf?src-supplier=RSComponents; ComponentLink2URL: https://datasheet.ciiva.com/12666/pyu-rc0402-51-rohs-l-6-r-12666741.pdf?src-supplier=Mouser; ComponentLink2Description: https://datasheet.ciiva.com/12666/pyu-rc0402-51-rohs-l-6-r-12666741.pdf?src-supplier=Mouser; ComponentLink3URL: https://datasheet.ciiva.com/17063/pyu-rc0402-51-rohs-l-6-r-17063193.pdf?src-supplier=Future+Electronics; ComponentLink3Description: https://datasheet.ciiva.com/17063/pyu-rc0402-51-rohs-l-6-r-17063193.pdf?src-supplier=Future+Electronics; ComponentLink4URL: https://datasheet.ciiva.com/22747/1018594-22747513.pdf?src-supplier=Element14; ComponentLink4Description: https://datasheet.ciiva.com/22747/1018594-22747513.pdf?src-supplier=Element14; ComponentLink5URL: https://datasheet.ciiva.com/7849/1018594-7849869.pdf?src-supplier=Element14; ComponentLink5Description: https://datasheet.ciiva.com/7849/1018594-7849869.pdf?src-supplier=Element14; ComponentLink6URL: https://datasheet.ciiva.com/7983/1018594-7983502.pdf?src-supplier=Element14; ComponentLink6Description: https://datasheet.ciiva.com/7983/1018594-7983502.pdf?src-supplier=Element14; ComponentLink7URL: https://datasheet.ciiva.com/7849/1018594-7849871.pdf?src-supplier=Element14; ComponentLink7Description: https://datasheet.ciiva.com/7849/1018594-7849871.pdf?src-supplier=Element14
U1 = 171031801: DC DC CONVERTER 0.8V-17V; Manufacturer: Wurth Elektronik; Input Voltage: 4-18V; Output Current: 3A; Output Voltage: 0.8-17V; Number of Outputs: 1; Min Input Voltage: 4V; Max Input Voltage: 18V; Voltage - Output 1: 17V; Efficiency: 95%; ComponentLink1Description: Manufacturer; ComponentLink1URL: http://www.we-online.de; ComponentLink2Description: Datasheet; ComponentLink2URL: https://katalog.we-online.de/pm/datasheet/171031801.pdf; Mounting Technology: SMT; Operating Temperature: -40 to +125degC; Manufacturer Part Number: 171031801; Packaging: Tape and Reel; Published Date: April 2020; Size: LGA-16EP; Supplier 1: Digi-Key; Supplier Part Number 1: 732-12297-1-ND; RoHS: No; Category: Board Mount Modules; Stock 1: 530; Pricing 1: 1=9,28000, 10=8,53900, 50=8,00360 (USD); Mount: Surface Mount; Min Operating Temperature: -40°C; Max Operating Temperature: 85°C; Features: UVLO,OCP,OTP,SCP; Max Output Current: 3A; ComponentLink3URL: https://katalog.we-online.de/pm/datasheet/171031801.pdf?src-supplier=Digi-Key; ComponentLink3Description: https://katalog.we-online.de/pm/datasheet/171031801.pdf?src-supplier=Digi-Key
U2 = AP2210K-5.0TRG1: IC REG LINEAR 5V 300MA SOT23-5; Manufacturer: Diodes; Output Type: Fixed; Power Supply Rejection Ratio (PSRR): 75dB; Number of Outputs: 1; Min Input Voltage: 2.5V; Max Input Voltage: 13.2V; Dropout Voltage: 250mV; Polarity: Positive; Quiescent Current: 150uA; Accuracy: 1%; Supplier 1: Digi-Key; Manufacturer Part Number: AP2210K-5.0TRG1; RoHS: Yes; Category: Voltage Regulators - Linear; Stock 1: 36767; Pricing 1: 1=0,42000, 10=0,34200, 25=0,31280, 100=0,21090, 250=0,17452, 500=0,15998, 1000=0,11999 (USD); Mount: Surface Mount; Case/Package: SOT-23-5; Number of Pins: 5; Weight: 0.001058oz; Min Operating Temperature: -40°C; Max Operating Temperature: 125°C; Max Output Current: 300mA; Output Voltage: 5V; Package Quantity: 3000; Packaging: Tape and Reel; Output Current: 300mA; Number of Regulators: 1; Lead Free: Lead Free; ComponentLink1URL: https://datasheet.ciiva.com/29569/ap2210-29569974.pdf?src-supplier=Digi-Key; ComponentLink1Description: https://datasheet.ciiva.com/29569/ap2210-29569974.pdf?src-supplier=Digi-Key; ComponentLink2URL: https://datasheet.ciiva.com/29569/ap2210-29569975.pdf?src-supplier=Digi-Key; ComponentLink2Description: https://datasheet.ciiva.com/29569/ap2210-29569975.pdf?src-supplier=Digi-Key; ComponentLink3URL: https://datasheet.ciiva.com/29569/ap2210-29569976.pdf?src-supplier=Digi-Key; ComponentLink3Description: https://datasheet.ciiva.com/29569/ap2210-29569976.pdf?src-supplier=Digi-Key; Supplier Part Number 1: AP2210K-5.0TRG1DICT-ND
U3 U4 = ADP125ACPZ-R7: IC REG LIN POS ADJ 500MA 8LFCSP; Manufacturer: Analog Devices; Output Voltage: 5V; Number of Outputs: 1; Dropout Voltage: 130mV; Max Input Voltage: 5.5V; Min Input Voltage: 2.3V; Min Current Limit: 550mA; Polarity: Positive; Quiescent Current: 45uA; Reference Voltage: 500mV; Min Output Voltage: 800mV; Accuracy: 1%; Power Supply Rejection Ratio (PSRR): 60dB; Max Supply Current: 210uA; Output Type: Adjustable; Supplier 1: Farnell; Manufacturer Part Number: ADP125ACPZ-R7; Stock 1: 261; RoHS: Yes; Case/Package: MSOP; Number of Pins: 8; Contact Plating: Gold; Min Operating Temperature: -40°C; Max Operating Temperature: 125°C; Output Current: 500mA; Max Output Current: 500mA; Packaging: Tape and Reel; Number of Regulators: 1; Max Output Voltage: 5V; Nominal Supply Current: 45uA; Operating Supply Current: 45uA; Length: 2mm; Height: 0.6mm; Width: 2mm; REACH SVHC: No SVHC; Lead Free: Contains Lead; ComponentLink1URL: https://datasheet.ciiva.com/17365/adp124-125-17365589.pdf?src-supplier=Avnet+Europe; ComponentLink1Description: https://datasheet.ciiva.com/17365/adp124-125-17365589.pdf?src-supplier=Avnet+Europe; ComponentLink2URL: https://datasheet.ciiva.com/2056/adp124-125-2056955.pdf?src-supplier=Digi-Key; ComponentLink2Description: https://datasheet.ciiva.com/2056/adp124-125-2056955.pdf?src-supplier=Digi-Key; ComponentLink3URL: https://datasheet.ciiva.com/2056/adp124-125-2056954.pdf?src-supplier=Digi-Key; ComponentLink3Description: https://datasheet.ciiva.com/2056/adp124-125-2056954.pdf?src-supplier=Digi-Key; ComponentLink4URL: https://datasheet.ciiva.com/2056/adp124-125-2056956.pdf?src-supplier=Digi-Key; ComponentLink4Description: https://datasheet.ciiva.com/2056/adp124-125-2056956.pdf?src-supplier=Digi-Key; ComponentLink5URL: https://datasheet.ciiva.com/48694/001251247-da-01-en-ic-reg-l-adj-adp125acpz-r7-lfcspud-8-adi-48694599.pdf?src-supplier=Conrad; ComponentLink5Description: https://datasheet.ciiva.com/48694/001251247-da-01-en-ic-reg-l-adj-adp125acpz-r7-lfcspud-8-adi-48694599.pdf?src-supplier=Conrad; Supplier 2: Digi-Key; Manufacturer 2: Analog Devices; Manufacturer Part Number 2: ADP125ACPZ-R7; Stock 2: 12322; Pricing 2: 1=1.39000, 10=1.23900, 25=1.17600, 100=0.96600, 250=0.90300, 500=0.79800, 1000=0.63000 (USD); ComponentLink6URL: http://datasheet.octopart.com/ADP125ACPZ-R7-Analog-Devices-datasheet-11525030.pdf?src-supplier=Newark; ComponentLink6Description: http://datasheet.octopart.com/ADP125ACPZ-R7-Analog-Devices-datasheet-11525030.pdf?src-supplier=Newark; ComponentLink7URL: http://datasheet.octopart.com/ADP125ACPZ-R7-Analog-Devices-datasheet-38878834.pdf?src-supplier=Newark; ComponentLink7Description: http://datasheet.octopart.com/ADP125ACPZ-R7-Analog-Devices-datasheet-38878834.pdf?src-supplier=Newark; ComponentLink8URL: http://datasheet.octopart.com/ADP125ACPZ-R7-Analog-Devices-datasheet-10623001.pdf?src-supplier=Analog+Devices; ComponentLink8Description: http://datasheet.octopart.com/ADP125ACPZ-R7-Analog-Devices-datasheet-10623001.pdf?src-supplier=Analog+Devices; ComponentLink9URL: http://datasheet.octopart.com/ADP125ACPZ-R7-Analog-Devices-datasheet-8638579.pdf?src-supplier=Analog+Devices; ComponentLink9Description: http://datasheet.octopart.com/ADP125ACPZ-R7-Analog-Devices-datasheet-8638579.pdf?src-supplier=Analog+Devices; ComponentLink10URL: http://datasheet.octopart.com/ADP125ACPZ-R7-Analog-Devices-datasheet-11776558.pdf?src-supplier=Arrow; ComponentLink10Description: http://datasheet.octopart.com/ADP125ACPZ-R7-Analog-Devices-datasheet-11776558.pdf?src-supplier=Arrow; Supplier Part Number 2: ADP125ACPZ-R7CT-ND; Supplier Part Number 1: 2457144